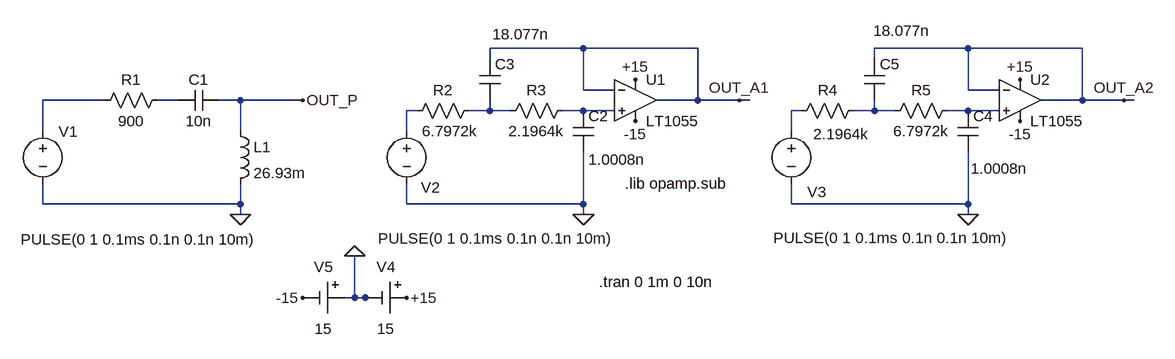
[diagram p0: schematic simu_indicielle_LT1055_measured_components.asc]
simu_indicielle_LT1055_measured_components.asc, the LTspice schematic file:
Version 4.1
SHEET 1 1680 680
WIRE 784 64 640 64
WIRE 960 64 784 64
WIRE 1376 64 1232 64
WIRE 1552 64 1376 64
WIRE 640 80 640 64
WIRE 1232 80 1232 64
WIRE 784 128 784 64
WIRE 832 128 784 128
WIRE 1376 128 1376 64
WIRE 1424 128 1376 128
WIRE 48 144 -48 144
WIRE 160 144 128 144
WIRE 256 144 224 144
WIRE 352 144 256 144
WIRE 960 144 960 64
WIRE 960 144 896 144
WIRE 1024 144 960 144
WIRE 1040 144 1024 144
WIRE 1552 144 1552 64
WIRE 1552 144 1488 144
WIRE 1616 144 1552 144
WIRE 1632 144 1616 144
WIRE 528 160 512 160
WIRE 640 160 640 144
WIRE 640 160 608 160
WIRE 672 160 640 160
WIRE 784 160 752 160
WIRE 832 160 784 160
WIRE 1120 160 1104 160
WIRE 1232 160 1232 144
WIRE 1232 160 1200 160
WIRE 1264 160 1232 160
WIRE 1376 160 1344 160
WIRE 1424 160 1376 160
WIRE -48 192 -48 144
WIRE 256 192 256 144
WIRE 512 192 512 160
WIRE 1104 192 1104 160
WIRE -48 304 -48 272
WIRE 256 304 256 272
WIRE 256 304 -48 304
WIRE 512 304 512 272
WIRE 784 304 784 224
WIRE 784 304 512 304
WIRE 1104 304 1104 272
WIRE 1376 304 1376 224
WIRE 1376 304 1104 304
WIRE 256 320 256 304
WIRE 784 320 784 304
WIRE 1376 320 1376 304
WIRE 432 448 432 384
WIRE 432 448 416 448
WIRE 448 448 432 448
WIRE 464 448 448 448
FLAG 352 144 OUT_P
FLAG 256 320 0
FLAG 784 320 0
FLAG 1024 144 OUT_A1
FLAG 1376 320 0
FLAG 1616 144 OUT_A2
FLAG 432 384 0
FLAG 512 448 +15
FLAG 864 112 +15
FLAG 1456 112 +15
FLAG 352 448 -15
FLAG 864 176 -15
FLAG 1456 176 -15
SYMBOL res 144 128 R90
WINDOW 0 0 56 VBottom 2
WINDOW 3 32 56 VTop 2
SYMATTR InstName R1
SYMATTR Value 900
SYMBOL ind 240 176 R0
SYMATTR InstName L1
SYMATTR Value 26.93m
SYMATTR SpiceLine Rser=1m
SYMBOL cap 224 128 R90
WINDOW 0 0 32 VBottom 2
WINDOW 3 32 32 VTop 2
SYMATTR InstName C1
SYMATTR Value 10n
SYMBOL voltage -48 176 R0
WINDOW 123 9 101 Left 2
WINDOW 39 0 0 Left 0
WINDOW 3 -34 182 Left 2
SYMATTR Value PULSE(0 1 0.1ms 0.1n 0.1n 10m)
SYMATTR InstName V1
SYMBOL cap 768 160 R0
WINDOW 3 24 75 Left 2
SYMATTR InstName C2
SYMATTR Value 1.0008n
SYMBOL cap 624 80 R0
WINDOW 3 20 -38 Left 2
SYMATTR InstName C3
SYMATTR Value 18.077n
SYMBOL res 624 144 R90
WINDOW 0 0 56 VBottom 2
WINDOW 3 32 45 VTop 2
SYMATTR InstName R2
SYMATTR Value 6.7972k
SYMBOL res 768 144 R90
WINDOW 0 0 56 VBottom 2
WINDOW 3 32 56 VTop 2
SYMATTR InstName R3
SYMATTR Value 2.1964k
SYMBOL cap 1360 160 R0
WINDOW 3 20 89 Left 2
SYMATTR InstName C4
SYMATTR Value 1.0008n
SYMBOL cap 1216 80 R0
WINDOW 3 14 -43 Left 2
SYMATTR InstName C5
SYMATTR Value 18.077n
SYMBOL res 1216 144 R90
WINDOW 0 0 56 VBottom 2
WINDOW 3 36 35 VTop 2
SYMATTR InstName R4
SYMATTR Value 2.1964k
SYMBOL res 1360 144 R90
WINDOW 0 0 56 VBottom 2
WINDOW 3 32 56 VTop 2
SYMATTR InstName R5
SYMATTR Value 6.7972k
SYMBOL voltage 512 176 R0
WINDOW 123 9 101 Left 2
WINDOW 39 0 0 Left 0
WINDOW 3 -44 181 Left 2
WINDOW 0 22 102 Left 2
SYMATTR Value PULSE(0 1 0.1ms 0.1n 0.1n 10m)
SYMATTR InstName V2
SYMBOL voltage 1104 176 R0
WINDOW 123 9 101 Left 2
WINDOW 39 0 0 Left 0
WINDOW 3 -28 180 Left 2
WINDOW 0 25 109 Left 2
SYMATTR Value PULSE(0 1 0.1ms 0.1n 0.1n 10m)
SYMATTR InstName V3
SYMBOL Misc\\cell 512 448 R90
WINDOW 0 -32 32 VBottom 2
WINDOW 3 32 32 VTop 2
SYMATTR InstName V4
SYMATTR Value 15
SYMBOL Misc\\cell 416 448 R90
WINDOW 0 -32 32 VBottom 2
WINDOW 3 32 32 VTop 2
SYMATTR InstName V5
SYMATTR Value 15
SYMBOL OpAmps\\LT1055 864 80 R0
SYMATTR InstName U1
SYMBOL OpAmps\\LT1055 1456 80 R0
SYMATTR InstName U2
TEXT 848 272 Left 2 !.lib opamp.sub
TEXT 808 424 Left 2 !.tran 0 1m 0 10n

The netlist it stands for:
* simu_indicielle_LT1055_measured_components.asc
R1 N002 N001 900
L1 OUT_P 0 26.93m Rser=1m
C1 OUT_P N002 10n
V1 N001 0 PULSE(0 1 0.1ms 0.1n 0.1n 10m)
C2 N005 0 1.0008n
C3 OUT_A1 N004 18.077n
R2 N004 N003 6.7972k
R3 N005 N004 2.1964k
C4 N008 0 1.0008n
C5 OUT_A2 N007 18.077n
R4 N007 N006 2.1964k
R5 N008 N007 6.7972k
V2 N003 0 PULSE(0 1 0.1ms 0.1n 0.1n 10m)
V3 N006 0 PULSE(0 1 0.1ms 0.1n 0.1n 10m)
V4 +15 0 15
V5 0 -15 15
X§U1 N005 OUT_A1 +15 -15 OUT_A1 LT1055  ; pins In+ In- V+ V- OUT
X§U2 N008 OUT_A2 +15 -15 OUT_A2 LT1055  ; pins In+ In- V+ V- OUT
.lib opamp.sub
.tran 0 1m 0 10n
.backanno
.end